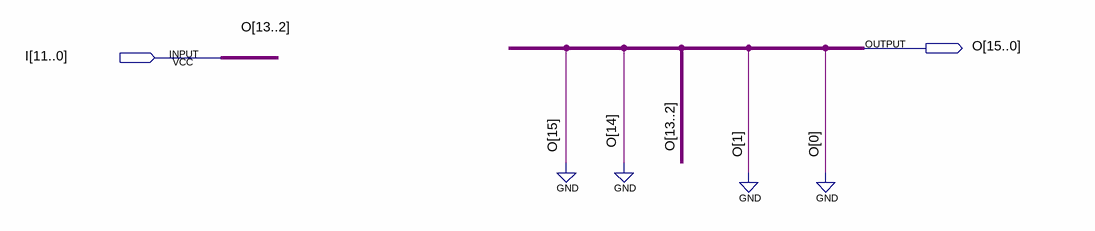
[diagram p0: schematic sheet]
// Quartus schematic mult2.bdf as structural Verilog: 0 symbols, 2 pins
module mult2 (
  input  [11:0] I,
  output [15:0] O
);


  assign O = {2'b00, I, 2'b00};
endmodule
